# Altium schematic sheet NC_Connectors.SchDoc
size Tabloid; SheetNumber: 3; SheetTotal: 5; Sheet_Name: Connecteurs; Size: 11x17
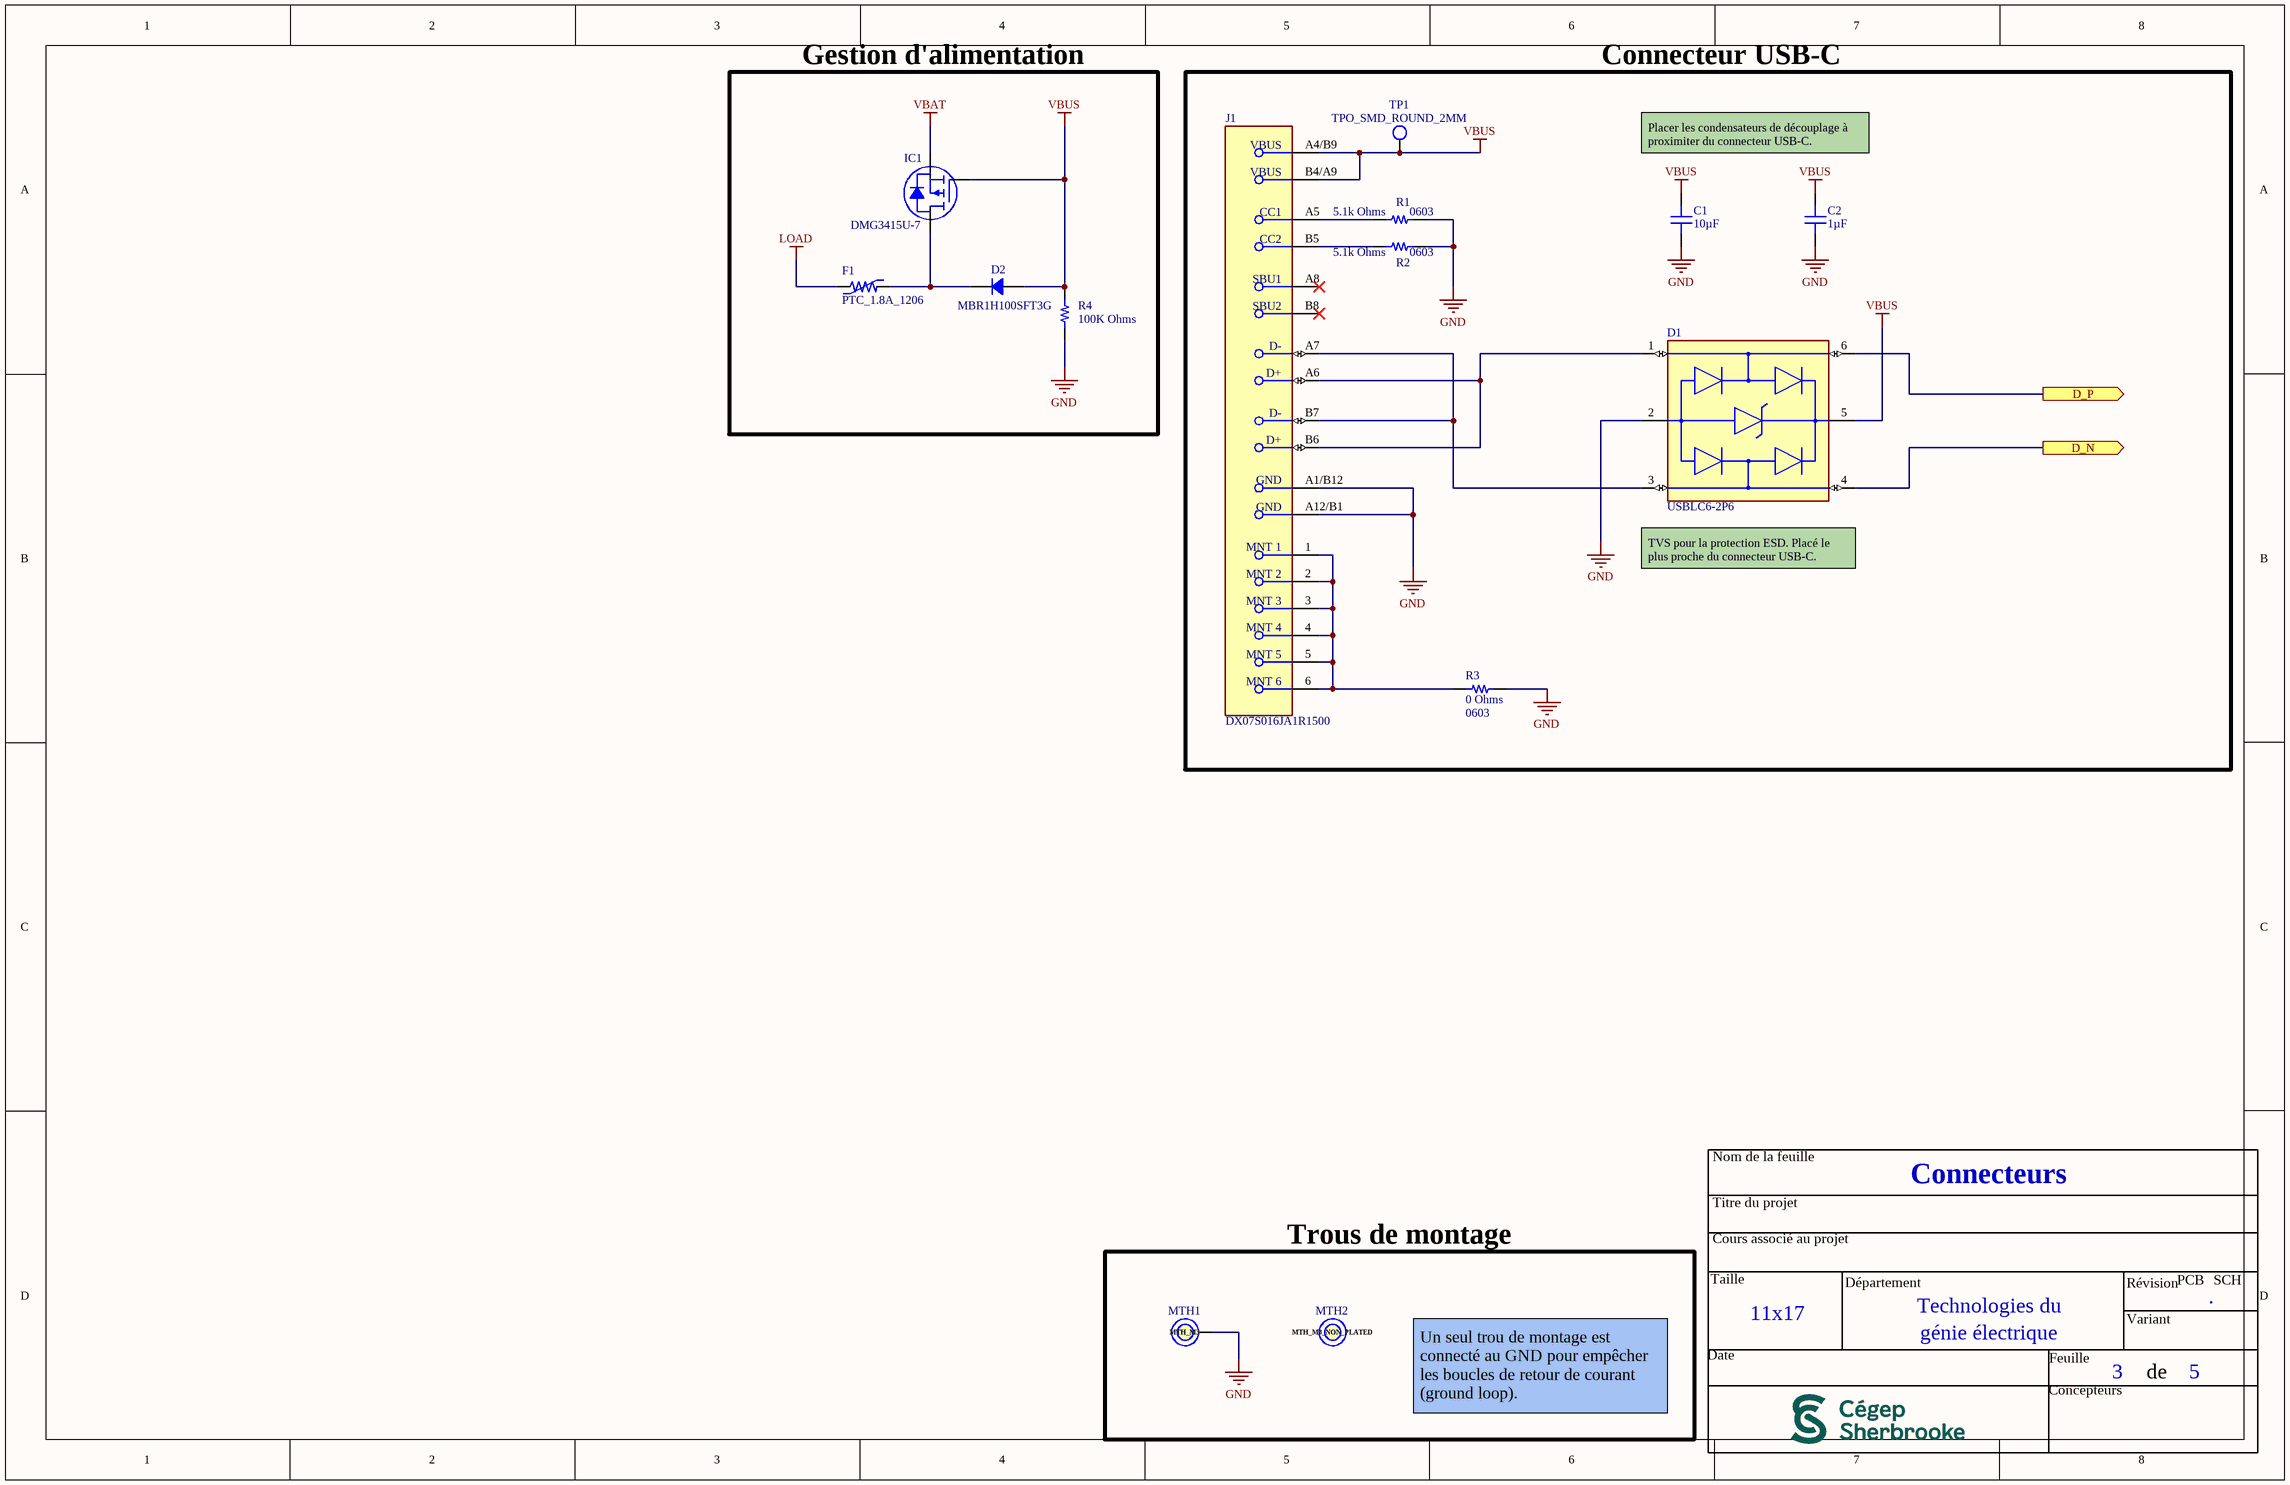
[diagram p0: NC_Connectors.SchDoc]

## Parts
C1  Capacitance: 10µF  [CAP 0603_1608]  (hidden comment: 1µF)
C2  1µF  [CAP 0603_1608]
D1  USBLC6-2P6  [FP-SOT-666-MFG]
D2  MBR1H100SFT3G  [SOD123F]
F1  PTC_1.8A_1206  [RESC3216X125N]
IC1  DMG3415U-7  [DIODES SOT-23-3]
J1  DX07S016JA1R1500  [FP-DX07S016JA1R1500-MFG]
MTH1  MTH_M3  [MTH_M3]  (no BOM)
MTH2  MTH_M3_NON_PLATED  [MTH_M3_NON_PLATED]  (no BOM)
R1  Supplier Device Package: 0603  [RES 0603_1608]  (hidden comment: 5.1k Ohms)
R2  Supplier Device Package: 0603  [RES 0603_1608]  (hidden comment: 5.1k Ohms)
R3  Supplier Device Package: 0603  [RES 0603_1608]  (hidden comment: 0 Ohms)
R4  100K Ohms  [RES 0603_1608]
TP1  TPO_SMD_ROUND_2MM  [TPO_SMD_ROUND_2MM]  (no BOM)

## Blocks framed on the sheet
Gestion d'alimentation: D2 F1 IC1 R4
Connecteur USB-C: C1 C2 D1 J1 R1-R3 TP1
Trous de montage: MTH1 MTH2

## Ports
D_N (out), D_P (out)

## Nets
GND: C1.1 C2.1 D1.2(GND) J1.A1/B12(GND) J1.A12/B1(GND) MTH1.1 R1.2 R2.2 R3.2 R4.1
LOAD: F1.1
VBAT: IC1.2(S)
VBUS: C1.2 C2.2 D1.5(VBUS) D2.1 IC1.1(G) J1.A4/B9(VBUS) J1.B4/A9(VBUS) R4.2 TP1.1
D_N: D1.4(I/O2) ; port D_N
D_P: D1.6(I/O1) ; port D_P
NetD1_1: D1.1(I/O1) J1.A6(D+) J1.B6(D+)
NetD1_3: D1.3(I/O2) J1.A7(D-) J1.B7(D-)
NetD2_2: D2.2 F1.2 IC1.3(D)
NetJ1_1: J1.1(MNT_1) J1.2(MNT_2) J1.3(MNT_3) J1.4(MNT_4) J1.5(MNT_5) J1.6(MNT_6) R3.1
NetJ1_A5: J1.A5(CC1) R1.1
NetJ1_B5: J1.B5(CC2) R2.1

Not connected (* = marked no-connect by the designer): J1 A8(SBU1)* B8(SBU2)*

## Notes on the sheet
- Placer les condensateurs de découplage à proximiter du connecteur USB-C.
- (near D1) TVS pour la protection ESD. Placé le plus proche du connecteur USB-C.
- Un seul trou de montage est connecté au GND pour empêcher les boucles de retour de courant (ground loop).
- Nom de la feuille
- Titre du projet
- Cours associé au projet
- Taille
- Département
- Technologies du
- Révision
- PCB
- .
- SCH
- Date
- génie électrique
- Feuille
- Variant
- de
- Concepteurs

## Library data of the parts
C1 C2 = 06035C105KAT2A: CAP CER 1UF 50V X7R 0603; manufacturer: AVX Corporation; Tolerance: ±10%; Part Number: 06035C105KAT2A; Applications: General Purpose; componentlink1description: Datasheet; componentlink1url: http://datasheets.avx.com/X7RDielectric.pdf; componentlink2description: DigiKey Link; componentlink2url: http://digikey.com/product-detail/en/avx-corporation/06035C105KAT2A/478-10073-1-ND/6564295; Device Package: 0603 (1608 Metric); lastupdated: 2020-09-02 1:03:35 AM; Lifecycle Status: Active; Minimum Order: 1; Mounting Type: Surface Mount, MLCC; Operating Temperature: -55°C ~ 125°C; Package / Case: 0603 (1608 Metric); packaging: TapeAndReel; partid: 2905; Part Status: Active; price: 0.15; series: -; Size / Dimension: 0.063" L x 0.032" W (1.60mm x 0.81mm); Supplier 1: DigiKey; Supplier Part Number 1: 478-10073-1-ND; Temperature Coefficient: X7R; Thickness (Max): 0.020" (0.50mm); value: 1µF; Voltage - Rated: 50V
  C2: Capacitance: 1µF
D1 = CMP-12225-000058-1: TVS DIODE 5.25V 17V SOT666; Min Breakdown Voltage: 6V; Power Line Protection: Yes; Element Configuration: Dual; Test Current: 1mA; Working Voltage: 5V; Number of Channels: 2; Max Reverse Leakage Current: 150nA; Direction: Unidirectional; Peak Pulse Current: 5A; Number of Elements: 1; Capacitance: 3.5pF; Max Breakdown Voltage: 6V; Height: 0.6mm; Depth: 1.3mm; Contact Plating: Tin; Reverse Breakdown Voltage: 6V; REACH SVHC: No SVHC; Operating Supply Voltage: 5V; Width: 1.3mm; Max Operating Temperature: 125°C; Reverse Standoff Voltage: 5V; ESD Protection: Yes; Package Quantity: 1; Termination: SMD/SMT; Length: 1.7mm; Leakage Current: 150nA; Number of Bidirectional Channels: 2; Case/Package: SOT-666; Min Operating Temperature: -40°C; Number of Pins: 6; Clamping Voltage: 17V; Breakdown Voltage: 6V; Lead Free: Lead Free; Radiation Hardening: No; Packaging: Tape and Reel; Mount: Surface Mount; Polarity: Unidirectional
D2 = MBR1H100SFT3G: DIODE SCHOTTKY 100V 1A SOD123FL; Manufacturer: ON Semiconductor; Current - Reverse Leakage @ Vr: 40µA @ 100V; Speed: Fast Recovery =< 500ns, > 200mA (Io); Voltage - Forward (Vf) (Max) @ If: 760mV @ 1A; Part Number: MBR1H100SFT3G; ComponentLink1Description: Datasheet; ComponentLink1URL: http://www.onsemi.com/pub/Collateral/MBR1H100SF-D.PDF; ComponentLink2Description: DigiKey Link; ComponentLink2URL: http://digikey.com/product-detail/en/on-semiconductor/MBR1H100SFT3G/MBR1H100SFT3GOSCT-ND/3462287; Current - Average Rectified (Io): 1A; Diode Type: Schottky; LastUpdated: 2026-04-05 8:31:56 PM; Lifecycle Status: Active; Minimum Order: 1; Mounting Type: Surface Mount; Operating Temperature - Junction: -65°C ~ 175°C; Package / Case: SOD-123F; Packaging: TapeAndReel; PartId: 2398; Part Status: Active; Price: 0.14; Series: -; Supplier 1: DigiKey; Supplier Part Number 1: MBR1H100SFT3GOSCT-ND; Supplier Device Package: SOD-123FL; Voltage - DC Reverse (Vr) (Max): 100V
F1 = CMP-005-000017-6: PTC Resettable Fuse 1A(hold) 1.8A(trip) 6VDC 100A 0.6W 0.3s 0.55Ohm SMD Solder Pad 1206 T/R Automotive; Resistance: 55mΩ; MF: Bel Fuse; Time to Trip: 300ms; Working Voltage: 6V; Maximum Resistance 1 Hour (R1max): 210mΩ; Package: 1206 Bel Fuse; China RoHS: Compliant; DigiKey-Purchase-URL: https://snapeda.com/shop?store=DigiKey&id=970476; Case Code (Imperial): 1206; Value: *; Price: None; Max Operating Temperature: 85°C; Lead Free: Lead Free; Availability: Good; Width: 1.8mm; Height: 1mm; REACH SVHC: Yes; Check_prices: https://www.snapeda.com/parts/0ZCJ0100FF2E/Bel%20Fuse%20Inc./view-part/970476/?ref=eda; Trip Current: 1.8A; Mouser-Purchase-URL: https://snapeda.com/shop?store=Mouser&id=970476; Design Item ID: 0ZCJ0100FF2E; Component Type: Standard; Number of Terminals: 2; Case Code (Metric): 3216; Mount: Surface Mount; MP: 0ZCJ0100FF2E; Min Operating Temperature: -40°C; SnapEDA_Link: https://www.snapeda.com/parts/0ZCJ0100FF2E/Bel%20Fuse%20Inc./view-part/970476/?ref=snap; Hold Current: 1A; Max Current Rating: 100A; Pin Count: 2; RoHS: Compliant; Source: 0ZCJ0100FF2E.SchLib; Lifecycle Status: Production; Case/Package: 1206; Packaging: Tape & Reel (TR)
IC1 = DMG3415U-7: MOSFET P-CH 20V 4A SOT23-3; Manufacturer: Diodes Incorporated; Current - Continuous Drain (Id) @ 25°C: 4A (Ta); Drive Voltage (Max Rds On,  Min Rds On): 1.8V, 4.5V; FET Type: P-Channel; Gate Charge (Qg) (Max) @ Vgs: 9.1 nC @ 4.5 V; Input Capacitance (Ciss) (Max) @ Vds: 294 pF @ 10 V; Power Dissipation (Max): 900mW (Ta); Rds On (Max) @ Id, Vgs: 39mOhm @ 4A, 4.5V; Vgs (Max): ±8V; Vgs(th) (Max) @ Id: 1V @ 250µA; Part Number: DMG3415U-7; ComponentLink1Description: Datasheet; ComponentLink1URL: //media.digikey.com/pdf/Data%20Sheets/Diodes%20PDFs/DMG3415U.pdf; ComponentLink2Description: DigiKey Link; ComponentLink2URL: https://www.digikey.com/en/products/detail/diodes-incorporated/DMG3415U-7/2052768; Drain to Source Voltage (Vdss): 20 V; LastUpdated: 2026-04-05 8:53:25 PM; Lifecycle Status: Active; Minimum Order: 1; Mounting Type: Surface Mount; Operating Temperature: -55°C ~ 150°C (TJ); Package / Case: TO-236-3, SC-59, SOT-23-3; Packaging: TapeAndReel; Part Status: Active; Price: 0.07; Series: -; Supplier 1: DigiKey; Supplier Part Number 1: DMG3415UDICT-ND; Supplier Device Package: SOT-23-3; Technology: MOSFET (Metal Oxide)
J1 = CMP-19038-000003-1: CONN RCP USB2.0 TYP C 24P SMD RA
MTH1 = CMP-006-000008-2: MTH - MOUNTING HOLE M3 PLATED - M3; Assembly Type: NONE; Component Type: Standard (No BOM); Manufacturer #1: *; Note: *; Polarized: *; Package: M3; Pin Count: 1; HelpURL: https://littlemachineshop.com/images/gallery/PDF/TapDrillSizes.pdf; Power Max: *; Value: *; Source: CEGEP_SHERBROOKE_TGE_LIBRARY.SchLib; Part Number #1: *; Design Item ID: MTH_M3
MTH2 = CMP-006-000010-2: MTH - MOUNTING HOLE M3 NON-PLATED - M3; Component Type: Standard (No BOM); Polarized: *; Package: M3; Note: *; Value: *; Power Max: *; Pin Count: 0; HelpURL: https://littlemachineshop.com/images/gallery/PDF/TapDrillSizes.pdf; Source: CEGEP_SHERBROOKE_TGE_LIBRARY.SchLib; Assembly Type: NONE; Part Number #1: *; Design Item ID: MTH_M3_NON_PLATED; Manufacturer #1: *
R1-R4 = ERJ-UP3J151V: RES 150 OHM 5% 1/4W 0603; Manufacturer: Panasonic Electronic Components; Power (Watts): 0.25W, 1/4W; Temperature Coefficient: ±200ppm/°C; Part Number: ERJ-UP3J151V; ComponentLink1Description: Datasheet; ComponentLink1URL: https://b2b-api.panasonic.eu/file_stream/pids/fileversion/4484; ComponentLink2Description: DigiKey Link; ComponentLink2URL: https://www.digikey.com/en/products/detail/panasonic-electronic-components/ERJ-UP3J151V/12092481; Composition: Thick Film; Device Package: 0603 (1608 Metric); Features: Anti-Sulfur, Automotive AEC-Q200, Pulse Withstanding; Height - Seated (Max): 0.022" (0.55mm); Lifecycle Status: Active; Minimum Order: 1; Number of Terminations: 2; Operating Temperature: -55°C ~ 155°C; Package / Case: 0603 (1608 Metric); Packaging: TapeAndReel; PartId: 63618; Part Status: Active; Price: 0.02; Ratings: AEC-Q200; Series: ERJ-UP3; Size / Dimension: 0.063" L x 0.031" W (1.60mm x 0.80mm); Supplier 1: DigiKey; Supplier Part Number 1: 10-ERJ-UP3J151VCT-ND; Tolerance: ±5%
  R1 R2: Value: 5.1k Ohms; LastUpdated: 2024-02-09 8:41:36 PM; Resistance: 5.1k Ohms
  R3: Value: 0 Ohms; LastUpdated: 2024-02-09 8:41:36 PM; Resistance: 0 Ohms
  R4: LastUpdated: 09/02/2024 20:41:36; Resistance: 100K Ohms; Supplier Device Package: 0603; Value: 100K Ohms
TP1 = CMP-007-000003-1: TPO - TEST POINT ROUND SMD PAD ONLY  - 2 MM; Component Type: Standard (No BOM); Polarized: *; Manufacturer #1: *; Part Number #1: *; HelpURL: *; Assembly Type: NONE; Source: CEGEP_SHERBROOKE_TGE_LIBRARY.SchLib; Design Item ID: TPO_SMD_ROUND_2MM; Pin Count: 1; Note: *; Value: *; Package: 2 MM ROUND; Power Max: *